# Altium schematic sheet esp32p10displaySheet2.SchDoc
size A4; SheetNumber: 2; SheetTotal: 4
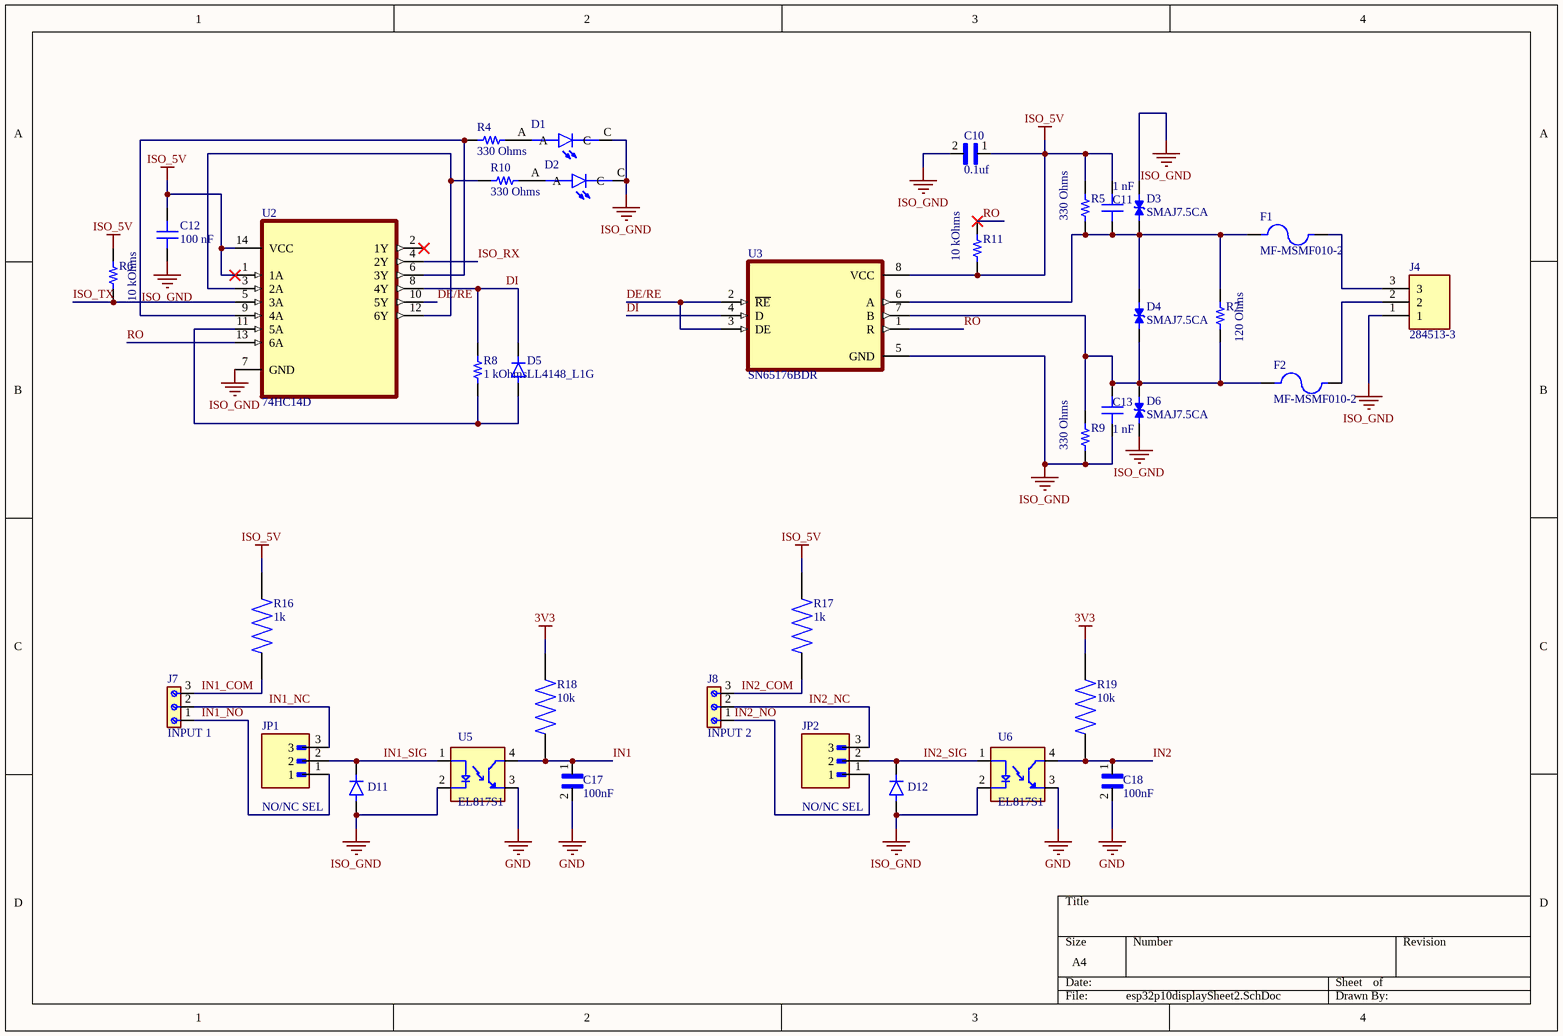
[diagram p0: esp32p10displaySheet2.SchDoc]

## Parts
C10  0.1uf  [CAPC2012X140N]
C11  Capacitance: 1 nF  [CAP 0805_2012]  (hidden comment: 1nF)
C12  Capacitance: 100 nF  [CAP 0805_2012]  (hidden comment: 100nF)
C13  Capacitance: 1 nF  [CAP 0805_2012]  (hidden comment: 1nF)
C17  100nF  [CAPC2012X140N]
C18  100nF  [CAPC2012X140N]
D1  597-3305-607F  [LEDC2012X70N]  (value not drawn)
D2  597-3305-607F  [LEDC2012X70N]  (value not drawn)
D3  SMAJ7.5CA  [DIOM4325X250N]
D4  SMAJ7.5CA  [DIOM4325X250N]
D5  LL4148_L1G  [DIOMELF3515N]
D6  SMAJ7.5CA  [DIOM4325X250N]
D11  LL4148_L1G  [DIOMELF3515N]  (value not drawn)
D12  LL4148_L1G  [DIOMELF3515N]  (value not drawn)
F1  MF-MSMF010-2  [FUSER_MF-MSMF010-2]
F2  MF-MSMF010-2  [FUSER_MF-MSMF010-2]
J4  284513-3  [TE_284513-3]
J7  INPUT 1  [691236510003]
J8  INPUT 2  [691236510003]
JP1  NO/NC SEL  [AMPHENOL_68001-403HLF]
JP2  NO/NC SEL  [AMPHENOL_68001-403HLF]
R4  330 Ohms  [RES 0805_2012]
R5  330 Ohms  [RES 0805_2012]
R6  10 kOhms  [RES 0805_2012]
R7  120 Ohms  [RES 0805_2012]
R8  1 kOhms  [RES 0805_2012]
R9  330 Ohms  [RES 0805_2012]
R10  330 Ohms  [RES 0805_2012]
R11  10 kOhms  [RES 0805_2012]
R16  1k  [RES_ERA6VRB1002V]
R17  1k  [RES_ERA6VRB1002V]
R18  10k  [RES_ERA6VRB1002V]
R19  10k  [RES_ERA6VRB1002V]
U2  74HC14D  [SOIC127P600X175-14N]
U3  SN65176BDR  [SOIC127P599X175-8N]
U5  EL817S1  [SOIC254P1030X390-4N_EL817S1(A)(TU)-V]
U6  EL817S1  [SOIC254P1030X390-4N_EL817S1(A)(TU)-V]

## Nets
3V3: R18.2 R19.2
GND: C17.2 C18.2 U5.3(ET) U6.3(ET)
ISO_5V: C10.1 C11.2 C12.2 R5.2 R6.2 R11.1 R16.2 R17.2 U2.1(1A) U2.14(VCC) U3.8(VCC)
ISO_GND: C10.2 C12.1 C13.1 D1.C D2.C D3.2 D6.1 D11.A D12.A J4.1 R9.1 U2.7(GND) U3.5(GND) U5.2(C) U6.2(C)
DE/RE: U2.10(5Y) U3.2(~{RE}) U3.3(DE)
DI: D5.C(K) R8.2 U2.8(4Y) U3.4(D)
IN1: C17.1 R18.1 U5.4(CT)
IN1_COM: J7.3 R16.1
IN1_NC: J7.2 JP1.3
IN1_NO: J7.1 JP1.1
IN1_SIG: D11.C(K) JP1.2 U5.1(A)
IN2: C18.1 R19.1 U6.4(CT)
IN2_COM: J8.3 R17.1
IN2_NC: J8.2 JP2.3
IN2_NO: J8.1 JP2.1
IN2_SIG: D12.C(K) JP2.2 U6.1(A)
ISO_RX: U2.4(2Y)
ISO_TX: R6.1 U2.5(3A)
RO: R11.2 U2.13(6A) U3.1(R)
NetC11_1: C11.1 D3.1 D4.2 F1.1 R5.1 R7.2 U3.6(A)
NetC13_2: C13.2 D4.1 D6.2 F2.1 R7.1 R9.2 U3.7(B)
NetD1_A: D1.A R4.2
NetD2_A: D2.A R10.2
NetD5_A: D5.A R8.1 U2.11(5A)
NetF1_2: F1.2 J4.3
NetF2_2: F2.2 J4.2
NetR4_1: R4.1 U2.6(3Y) U2.9(4A)
NetR10_1: R10.1 U2.3(2A) U2.12(6Y)

Not connected (* = marked no-connect by the designer): U2 2(1Y)*

## Library data of the parts
C10 C17 C18 = CL21B104KCFNNNE: 0.1 ÂµF Â±10% 100V Ceramic Capacitor X7R 0805 (2012 Metric); MF: Samsung; Purchase-URL: https://pricing.snapeda.com/search?q=CL21B104KCFNNNE&ref=eda; Package: 0805 Samsung; Check_prices: https://www.snapeda.com/parts/CL21B104KCFNNNE/Samsung+Electro-Mechanics/view-part/?ref=eda; Value: *; SnapEDA_Link: https://www.snapeda.com/parts/CL21B104KCFNNNE/Samsung+Electro-Mechanics/view-part/?ref=snap; MP: CL21B104KCFNNNE; Digi-Key_Part_Number: 1276-6840-2-ND
C11 C13 = C0805C102F3HACAUTO: CAP CER 0805 1NF 25V ULTRA STABL; manufacturer: KEMET; Temperature Coefficient: X8R; Tolerance: ±1%; value: 1000 pF; Part Number: C0805C102F3HACAUTO; Applications: Automotive; componentlink1description: Datasheet; componentlink1url: https://api.kemet.com/component-edge/download/datasheet/C0805C102F3HACAUTO.pdf; componentlink2description: DigiKey Link; componentlink2url: https://www.digikey.com/en/products/detail/kemet/C0805C102F3HACAUTO/7958218; Device Package: 0805 (2012 Metric); Features: Low ESL, High Temperature; lastupdated: 09-02-2024 8.15.10 PM; Lifecycle Status: Active; Minimum Order: 1; Mounting Type: Surface Mount, MLCC; Operating Temperature: -55°C ~ 150°C; Package / Case: 0805 (2012 Metric); packaging: TapeAndReel; partid: 32894; Part Status: Active; price: 0.04; Ratings: AEC-Q200; series: SMD Auto X8R HT150C; Size / Dimension: 0.079" L x 0.049" W (2.00mm x 1.25mm); Supplier 1: DigiKey; Supplier Part Number 1: 399-C0805C102F3HACAUTOCT-ND; Thickness (Max): 0.035" (0.88mm); Voltage - Rated: 25V
C12 = C0805C102F3HACAUTO: CAP CER 0805 0.1UF 100V X7R; Part Number: CL21B104KCFNNNE; manufacturer: Samsung Electro-Mechanics; Tolerance: ±10%; Applications: General Purpose; componentlink1description: Datasheet; componentlink1url: https://pricing.snapeda.com/search?q=CL21B104KCFNNNE&ref=eda; componentlink2description: DigiKey Link; componentlink2url: https://www.digikey.com/en/products/result?keywords=CL21B104KCFNNNE; Device Package: 0805 (2012 Metric); lastupdated: 09-02-2024 8.15.10 PM; Lifecycle Status: Active; Minimum Order: 1; Mounting Type: Surface Mount, MLCC; Operating Temperature: -55°C ~ 125°C; Package / Case: 0805 (2012 Metric); packaging: TapeAndReel; Part Status: Active; series: CL; Size / Dimension: 0.079" L x 0.049" W (2.00mm x 1.25mm); Supplier 1: DigiKey; Temperature Coefficient: X7R; Thickness (Max): 0.85mm; value: 100 nF; Voltage - Rated: 100V
D1 D2 = 597-3305-607F: LED Uni-Color Green 4-Pin Chip 0805 T/R; Availability: Unavailable; Value: *; Price: None; MP: 597-3305-607F; Package: None
F1 F2 = MF-MSMF010-2: Polymeric PTC Resettable Fuse 60V 100 mA Ih Surface Mount 1812 (4532 Metric), Concave; MF: Bourns; Price: None; Availability: In Stock; MP: MF-MSMF010-2; Package: 1812 Bourns; SnapEDA_Link: https://www.snapeda.com/parts/MF-MSMF010-2/Bourns/view-part/?ref=snap; Check_prices: https://www.snapeda.com/parts/MF-MSMF010-2/Bourns/view-part/?ref=eda; Value: *; Purchase-URL: https://pricing.snapeda.com/search/part/MF-MSMF010-2/?ref=eda
J4 = 284513-3: 3 Position 3.81 mm Pitch Green Right Angle Through Hole Terminal Block Header; MF: TE Connectivity; Purchase-URL: https://pricing.snapeda.com/search/part/284513-3/?ref=eda; Package: None; MP: 284513-3; EU_RoHS_Compliance: Compliant; Price: None; Availability: In Stock; Value: *; Check_prices: https://www.snapeda.com/parts/284513-3/TE+Connectivity+AMP+Connectors/view-part/?ref=eda; SnapEDA_Link: https://www.snapeda.com/parts/284513-3/TE+Connectivity+AMP+Connectors/view-part/?ref=snap
J7 J8 = 691236510003: 3 Position Wire to Board Terminal Block Horizontal with Board 0.200 (5.08mm) Through Hole; MF: WÃ¼rth Elektronik; SnapEDA_Link: https://www.snapeda.com/parts/691236510003/W%25C3%25BCrth+Elektronik+Midcom/view-part/?ref=snap; Package: None; Value: *; MP: 691236510003; Check_prices: https://www.snapeda.com/parts/691236510003/W%25C3%25BCrth+Elektronik+Midcom/view-part/?ref=eda
JP1 JP2 = 68001-403HLF: Package: None; Price: None; Value: *; MP: 68001-403HLF; Availability: Unavailable
R4 R10 = CRCW0805330RFKEAHP: RES SMD 330 OHM 1% 1/2W 0805; Manufacturer: Vishay Dale; Power (Watts): 0.5W, 1/2W; Temperature Coefficient: ±100ppm/°C; Part Number: CRCW0805330RFKEAHP; Value: 330 Ohms; ComponentLink1Description: Datasheet; ComponentLink1URL: http://www.vishay.com/docs/20043/crcwhpe3.pdf; ComponentLink2Description: DigiKey Link; ComponentLink2URL: https://www.digikey.com/en/products/detail/vishay-dale/CRCW0805330RFKEAHP/2226912; Composition: Thick Film; Device Package: 0805 (2012 Metric); Features: Automotive AEC-Q200, Pulse Withstanding; Height - Seated (Max): 0.020" (0.50mm); LastUpdated: 08-02-2024 9.02.28 PM; Lifecycle Status: Active; Minimum Order: 1; Number of Terminations: 2; Operating Temperature: -55°C ~ 155°C; Package / Case: 0805 (2012 Metric); Packaging: TapeAndReel; PartId: 30364; Part Status: Active; Price: 0.02; Ratings: AEC-Q200; Resistance: 330 Ohms; Series: CRCW-HP; Size / Dimension: 0.079" L x 0.049" W (2.00mm x 1.25mm); Supplier 1: DigiKey; Supplier Part Number 1: 541-330TCT-ND; Supplier Device Package: 0805; Tolerance: ±1%
R5 R9 = CPF0805B1K0E: RES SMD 330 OHM 1% 1/8W 0805; Part Number: RC0805FR-07330RL; Manufacturer: YAGEO; Power (Watts): 0.1W, 1/10W; Temperature Coefficient: ±25ppm/°C; Tolerance: ±0.1%; Value: 330 Ohms; ComponentLink1Description: Datasheet; ComponentLink1URL: https://www.te.com/commerce/DocumentDelivery/DDEController?Action=srchrtrv&DocNm=1773200&DocType=DS&DocLang=English; ComponentLink2Description: DigiKey Link; Composition: Thin Film; Device Package: 0805 (2012 Metric); Height - Seated (Max): 0.026" (0.65mm); LastUpdated: 08-02-2024 9.02.39 PM; Lifecycle Status: Active; Minimum Order: 1; Number of Terminations: 2; Operating Temperature: -55°C ~ 155°C; Package / Case: 0805 (2012 Metric); Packaging: TapeAndReel; PartId: 27725; Part Status: Active; Price: 0.09; Resistance: 330 Ohms; Series: CPF, Neohm; Size / Dimension: 0.079" L x 0.049" W (2.00mm x 1.25mm); Supplier 1: DigiKey; Supplier Device Package: 0805
R6 R11 = CPF0805B10KE: RES SMD 10K OHM 0.1% 1/10W 0805; Manufacturer: TE Connectivity Passive Product; Power (Watts): 0.1W, 1/10W; Temperature Coefficient: ±25ppm/°C; Part Number: CPF0805B10KE; Value: 10 kOhms; ComponentLink1Description: Datasheet; ComponentLink1URL: https://www.te.com/commerce/DocumentDelivery/DDEController?Action=srchrtrv&DocNm=1773200&DocType=DS&DocLang=English; ComponentLink2Description: DigiKey Link; ComponentLink2URL: https://www.digikey.com/en/products/detail/te-connectivity-passive-product/CPF0805B10KE/2389790; Composition: Thin Film; Device Package: 0805 (2012 Metric); Height - Seated (Max): 0.026" (0.65mm); LastUpdated: 08-02-2024 9.02.39 PM; Lifecycle Status: Active; Minimum Order: 1; Number of Terminations: 2; Operating Temperature: -55°C ~ 155°C; Package / Case: 0805 (2012 Metric); Packaging: TapeAndReel; PartId: 27724; Part Status: Active; Price: 0.09; Resistance: 10 kOhms; Series: CPF, Neohm; Size / Dimension: 0.079" L x 0.049" W (2.00mm x 1.25mm); Supplier 1: DigiKey; Supplier Part Number 1: A106043CT-ND; Supplier Device Package: 0805; Tolerance: ±0.1%
R7 = CPF0805B10KE: RES SMD 120 OHM 1% 1/8W 0805; Part Number: RC0805FR-07120RL; Manufacturer: YAGEO; Power (Watts): 0.1W, 1/10W; Temperature Coefficient: ±25ppm/°C; Tolerance: ±0.1%; Value: 120 Ohms; ComponentLink1Description: Datasheet; ComponentLink1URL: https://www.te.com/commerce/DocumentDelivery/DDEController?Action=srchrtrv&DocNm=1773200&DocType=DS&DocLang=English; ComponentLink2Description: DigiKey Link; Composition: Thin Film; Device Package: 0805 (2012 Metric); Height - Seated (Max): 0.026" (0.65mm); LastUpdated: 08-02-2024 9.02.39 PM; Lifecycle Status: Active; Minimum Order: 1; Number of Terminations: 2; Operating Temperature: -55°C ~ 155°C; Package / Case: 0805 (2012 Metric); Packaging: TapeAndReel; PartId: 27724; Part Status: Active; Price: 0.09; Resistance: 120 Ohms; Series: CPF, Neohm; Size / Dimension: 0.079" L x 0.049" W (2.00mm x 1.25mm); Supplier 1: DigiKey; Supplier Device Package: 0805
R8 = CPF0805B1K0E: RES SMD 1K OHM 0.1% 1/10W 0805; Manufacturer: TE Connectivity Passive Product; Power (Watts): 0.1W, 1/10W; Temperature Coefficient: ±25ppm/°C; Part Number: CPF0805B1K0E; Value: 1 kOhms; ComponentLink1Description: Datasheet; ComponentLink1URL: https://www.te.com/commerce/DocumentDelivery/DDEController?Action=srchrtrv&DocNm=1773200&DocType=DS&DocLang=English; ComponentLink2Description: DigiKey Link; ComponentLink2URL: https://www.digikey.com/en/products/detail/te-connectivity-passive-product/CPF0805B1K0E/2390399; Composition: Thin Film; Device Package: 0805 (2012 Metric); Height - Seated (Max): 0.026" (0.65mm); LastUpdated: 08-02-2024 9.02.39 PM; Lifecycle Status: Active; Minimum Order: 1; Number of Terminations: 2; Operating Temperature: -55°C ~ 155°C; Package / Case: 0805 (2012 Metric); Packaging: TapeAndReel; PartId: 27725; Part Status: Active; Price: 0.09; Resistance: 1 kOhms; Series: CPF, Neohm; Size / Dimension: 0.079" L x 0.049" W (2.00mm x 1.25mm); Supplier 1: DigiKey; Supplier Part Number 1: A106044CT-ND; Supplier Device Package: 0805; Tolerance: ±0.1%
R16 R17 = ERA6VRB1002V: MP: ERA6VRB1001V; Availability: Unavailable; Package: None; Value: *; Price: None
R18 R19 = ERA6VRB1002V: Availability: Unavailable; Package: None; MP: ERA6VRB1002V; Value: *; Price: None
U2 = 74HC14D: Inverter IC 6 Channel Schmitt Trigger 14-SOIC; MF: Toshiba; SnapEDA_Link: https://www.snapeda.com/parts/74HC14D/Toshiba/view-part/?ref=snap; Package: SO14-14 Nexperia USA Inc.; Value: *; MP: 74HC14D; Check_prices: https://www.snapeda.com/parts/74HC14D/Toshiba/view-part/?ref=eda
U3 = SN65176BDR: Differential Bus Transceiver; MF: Texas Instruments; SnapEDA_Link: https://www.snapeda.com/parts/SN65176BDR/Texas+Instruments/view-part/?ref=snap; Package: SOIC-8 Texas Instruments; Value: *; MP: SN65176BDR; Check_prices: https://www.snapeda.com/parts/SN65176BDR/Texas+Instruments/view-part/?ref=eda
U5 U6 = EL817S1(A)(TU)-V: Optoisoltr 5kv Transistor 4-Smd; MF: {'manufacturer': u'Everlight Electronics Co Ltd'}; Package: None; Price: None; Value: *; MP: EL817S1(A)(TU)-V; Availability: Unavailable
D3 D4 D6 = SMAJ7.5CA: Availability: Unavailable; Package: None; MP: SMAJ7.5CA; Value: *; Price: None
D5 D11 D12 = LL4148_L1G: MP: LL4148_L1G; Price: None; Package: None; Availability: Unavailable; Value: *